# Altium schematic sheet Optoisolators.SchDoc: PDM
size A3; SheetNumber: 6; SheetTotal: 8
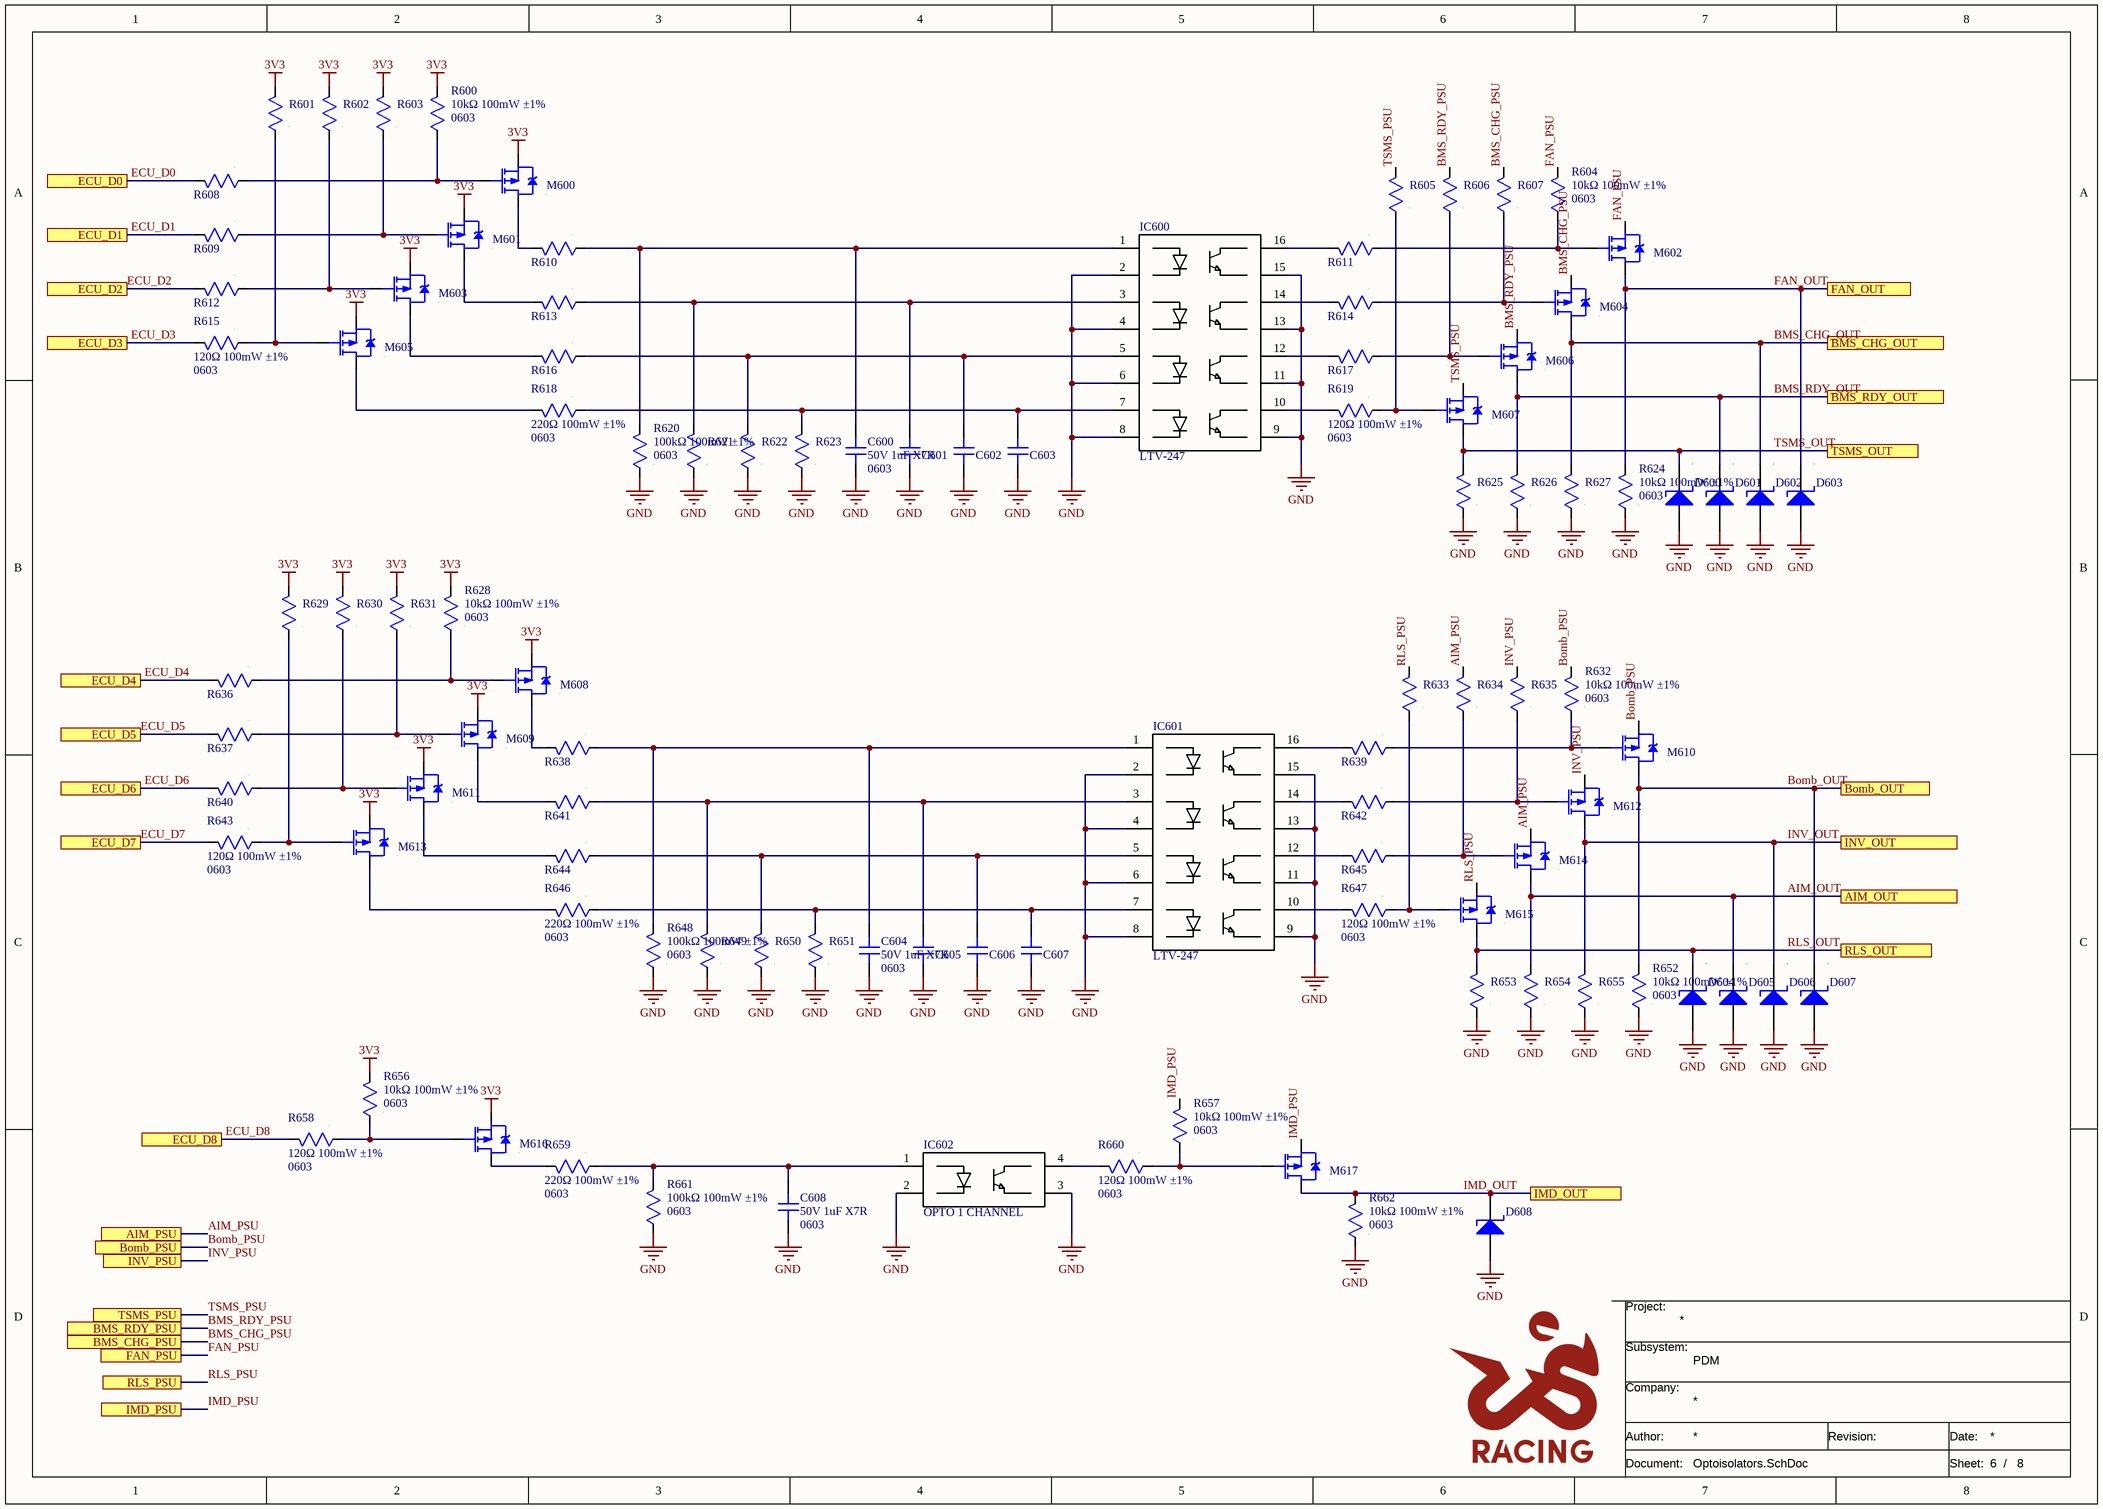
[diagram p0: Optoisolators.SchDoc]

## Parts
C600  value 50V 1uF X7R  Package: 0603  [CAP SMD 0603]  (hidden comment: CAP non polarized)
C601  CAP non polarized  [CAP SMD 0603]  (value not drawn)
C602  CAP non polarized  [CAP SMD 0603]  (value not drawn)
C603  CAP non polarized  [CAP SMD 0603]  (value not drawn)
C604  value 50V 1uF X7R  Package: 0603  [CAP SMD 0603]  (hidden comment: CAP non polarized)
C605  CAP non polarized  [CAP SMD 0603]  (value not drawn)
C606  CAP non polarized  [CAP SMD 0603]  (value not drawn)
C607  CAP non polarized  [CAP SMD 0603]  (value not drawn)
C608  value 50V 1uF X7R  Package: 0603  [CAP SMD 0603]  (hidden comment: CAP non polarized)
D600  DIODE SCHOTTKY  [DO-214AB]  (value not drawn)
D601  DIODE SCHOTTKY  [DO-214AB]  (value not drawn)
D602  DIODE SCHOTTKY  [DO-214AB]  (value not drawn)
D603  DIODE SCHOTTKY  [DO-214AB]  (value not drawn)
D604  DIODE SCHOTTKY  [DO-214AB]  (value not drawn)
D605  DIODE SCHOTTKY  [DO-214AB]  (value not drawn)
D606  DIODE SCHOTTKY  [DO-214AB]  (value not drawn)
D607  DIODE SCHOTTKY  [DO-214AB]  (value not drawn)
D608  DIODE SCHOTTKY  [DO-214AB]  (value not drawn)
IC600  LTV-247  [SOP-16]
IC601  LTV-247  [SOP-16]
IC602  OPTO 1 CHANNEL  [DIP-4]
M600  MOSFET P  [SOT-23]  (value not drawn)
M601  MOSFET P  [SOT-23]  (value not drawn)
M602  MOSFET P  [SOT-23]  (value not drawn)
M603  MOSFET P  [SOT-23]  (value not drawn)
M604  MOSFET P  [SOT-23]  (value not drawn)
M605  MOSFET P  [SOT-23]  (value not drawn)
M606  MOSFET P  [SOT-23]  (value not drawn)
M607  MOSFET P  [SOT-23]  (value not drawn)
M608  MOSFET P  [SOT-23]  (value not drawn)
M609  MOSFET P  [SOT-23]  (value not drawn)
M610  MOSFET P  [TO-252]  (value not drawn)
M611  MOSFET P  [SOT-23]  (value not drawn)
M612  MOSFET P  [SOT-23]  (value not drawn)
M613  MOSFET P  [SOT-23]  (value not drawn)
M614  MOSFET P  [SOT-23]  (value not drawn)
M615  MOSFET P  [SOT-23]  (value not drawn)
M616  MOSFET P  [SOT-23]  (value not drawn)
M617  MOSFET P  [SOT-23]  (value not drawn)
R600  value 10kΩ 100mW ±1%  Package: 0603  [RES SMD 0603]  (hidden comment: RES)
R601  RES  [RES SMD 0603]  (value not drawn)
R602  RES  [RES SMD 0603]  (value not drawn)
R603  RES  [RES SMD 0603]  (value not drawn)
R604  value 10kΩ 100mW ±1%  Package: 0603  [RES SMD 0603]  (hidden comment: RES)
R605  RES  [RES SMD 0603]  (value not drawn)
R606  RES  [RES SMD 0603]  (value not drawn)
R607  RES  [RES SMD 0603]  (value not drawn)
R608  RES  [RES SMD 0603]  (value not drawn)
R609  RES  [RES SMD 0603]  (value not drawn)
R610  RES  [RES SMD 0603]  (value not drawn)
R611  RES  [RES SMD 0603]  (value not drawn)
R612  RES  [RES SMD 0603]  (value not drawn)
R613  RES  [RES SMD 0603]  (value not drawn)
R614  RES  [RES SMD 0603]  (value not drawn)
R615  value 120Ω 100mW ±1%  Package: 0603  [RES SMD 0603]  (hidden comment: RES)
R616  RES  [RES SMD 0603]  (value not drawn)
R617  RES  [RES SMD 0603]  (value not drawn)
R618  value 220Ω 100mW ±1%  Package: 0603  [RES SMD 0603]  (hidden comment: RES)
R619  value 120Ω 100mW ±1%  Package: 0603  [RES SMD 0603]  (hidden comment: RES)
R620  value 100kΩ 100mW ±1%  Package: 0603  [RES SMD 0603]  (hidden comment: RES)
R621  RES  [RES SMD 0603]  (value not drawn)
R622  RES  [RES SMD 0603]  (value not drawn)
R623  RES  [RES SMD 0603]  (value not drawn)
R624  value 10kΩ 100mW ±1%  Package: 0603  [RES SMD 0603]  (hidden comment: RES)
R625  RES  [RES SMD 0603]  (value not drawn)
R626  RES  [RES SMD 0603]  (value not drawn)
R627  RES  [RES SMD 0603]  (value not drawn)
R628  value 10kΩ 100mW ±1%  Package: 0603  [RES SMD 0603]  (hidden comment: RES)
R629  RES  [RES SMD 0603]  (value not drawn)
R630  RES  [RES SMD 0603]  (value not drawn)
R631  RES  [RES SMD 0603]  (value not drawn)
R632  value 10kΩ 100mW ±1%  Package: 0603  [RES SMD 0603]  (hidden comment: RES)
R633  RES  [RES SMD 0603]  (value not drawn)
R634  RES  [RES SMD 0603]  (value not drawn)
R635  RES  [RES SMD 0603]  (value not drawn)
R636  RES  [RES SMD 0603]  (value not drawn)
R637  RES  [RES SMD 0603]  (value not drawn)
R638  RES  [RES SMD 0603]  (value not drawn)
R639  RES  [RES SMD 0603]  (value not drawn)
R640  RES  [RES SMD 0603]  (value not drawn)
R641  RES  [RES SMD 0603]  (value not drawn)
R642  RES  [RES SMD 0603]  (value not drawn)
R643  value 120Ω 100mW ±1%  Package: 0603  [RES SMD 0603]  (hidden comment: RES)
R644  RES  [RES SMD 0603]  (value not drawn)
R645  RES  [RES SMD 0603]  (value not drawn)
R646  value 220Ω 100mW ±1%  Package: 0603  [RES SMD 0603]  (hidden comment: RES)
R647  value 120Ω 100mW ±1%  Package: 0603  [RES SMD 0603]  (hidden comment: RES)
R648  value 100kΩ 100mW ±1%  Package: 0603  [RES SMD 0603]  (hidden comment: RES)
R649  RES  [RES SMD 0603]  (value not drawn)
R650  RES  [RES SMD 0603]  (value not drawn)
R651  RES  [RES SMD 0603]  (value not drawn)
R652  value 10kΩ 100mW ±1%  Package: 0603  [RES SMD 0603]  (hidden comment: RES)
R653  RES  [RES SMD 0603]  (value not drawn)
R654  RES  [RES SMD 0603]  (value not drawn)
R655  RES  [RES SMD 0603]  (value not drawn)
R656  value 10kΩ 100mW ±1%  Package: 0603  [RES SMD 0603]  (hidden comment: RES)
R657  value 10kΩ 100mW ±1%  Package: 0603  [RES SMD 0603]  (hidden comment: RES)
R658  value 120Ω 100mW ±1%  Package: 0603  [RES SMD 0603]  (hidden comment: RES)
R659  value 220Ω 100mW ±1%  Package: 0603  [RES SMD 0603]  (hidden comment: RES)
R660  value 120Ω 100mW ±1%  Package: 0603  [RES SMD 0603]  (hidden comment: RES)
R661  value 100kΩ 100mW ±1%  Package: 0603  [RES SMD 0603]  (hidden comment: RES)
R662  value 10kΩ 100mW ±1%  Package: 0603  [RES SMD 0603]  (hidden comment: RES)

## Ports
AIM_OUT, AIM_PSU, BMS_CHG_OUT, BMS_CHG_PSU, BMS_RDY_OUT, BMS_RDY_PSU, Bomb_OUT, Bomb_PSU, ECU_D0, ECU_D1, ECU_D2, ECU_D3, ECU_D4, ECU_D5, ECU_D6, ECU_D7, ECU_D8, FAN_OUT, FAN_PSU, IMD_OUT, IMD_PSU, INV_OUT, INV_PSU, RLS_OUT, RLS_PSU, TSMS_OUT, TSMS_PSU

## Nets
3V3: M600.2(S) M601.2(S) M603.2(S) M605.2(S) M608.2(S) M609.2(S) M611.2(S) M613.2(S) M616.2(S) R600.2 R601.2 R602.2 R603.2 R628.2 R629.2 R630.2 R631.2 R656.2
GND: C600.2 C601.2 C602.2 C603.2 C604.2 C605.2 C606.2 C607.2 C608.2 D600.A D601.A D602.A D603.A D604.A D605.A D606.A D607.A D608.A IC600.2(K_1) IC600.4(K_2) IC600.6(K_3) IC600.8(K_4) IC600.9(E_4) IC600.11(E_3) IC600.13(E_2) IC600.15(E_1) IC601.2(K_1) IC601.4(K_2) IC601.6(K_3) IC601.8(K_4) IC601.9(E_4) IC601.11(E_3) IC601.13(E_2) IC601.15(E_1) IC602.2(K_1) IC602.3(E_1) R620.1 R621.1 R622.1 R623.1 R624.1 R625.1 R626.1 R627.1 R648.1 R649.1 R650.1 R651.1 R652.1 R653.1 R654.1 R655.1 R661.1 R662.1
AIM_OUT: D605.K M614.3(D) R654.2 ; port AIM_OUT
AIM_PSU: M614.2(S) R634.2 ; port AIM_PSU
BMS_CHG_OUT: D602.K M604.3(D) R627.2 ; port BMS_CHG_OUT
BMS_CHG_PSU: M604.2(S) R607.2 ; port BMS_CHG_PSU
BMS_RDY_OUT: D601.K M606.3(D) R626.2 ; port BMS_RDY_OUT
BMS_RDY_PSU: M606.2(S) R606.2 ; port BMS_RDY_PSU
Bomb_OUT: D607.K M610.3(D) R652.2 ; port Bomb_OUT
Bomb_PSU: M610.2(S) R632.2 ; port Bomb_PSU
ECU_D0: R608.2 ; port ECU_D0
ECU_D1: R609.2 ; port ECU_D1
ECU_D2: R612.2 ; port ECU_D2
ECU_D3: R615.2 ; port ECU_D3
ECU_D4: R636.2 ; port ECU_D4
ECU_D5: R637.2 ; port ECU_D5
ECU_D6: R640.2 ; port ECU_D6
ECU_D7: R643.2 ; port ECU_D7
ECU_D8: R658.2 ; port ECU_D8
FAN_OUT: D603.K M602.3(D) R624.2 ; port FAN_OUT
FAN_PSU: M602.2(S) R604.2 ; port FAN_PSU
IMD_OUT: D608.K M617.3(D) R662.2 ; port IMD_OUT
IMD_PSU: M617.2(S) R657.2 ; port IMD_PSU
INV_OUT: D606.K M612.3(D) R655.2 ; port INV_OUT
INV_PSU: M612.2(S) R635.2 ; port INV_PSU
RLS_OUT: D604.K M615.3(D) R653.2 ; port RLS_OUT
RLS_PSU: M615.2(S) R633.2 ; port RLS_PSU
TSMS_OUT: D600.K M607.3(D) R625.2 ; port TSMS_OUT
TSMS_PSU: M607.2(S) R605.2 ; port TSMS_PSU
NetC600_1: C600.1 IC600.1(A_1) R610.1 R620.2
NetC601_1: C601.1 IC600.3(A_2) R613.1 R621.2
NetC602_1: C602.1 IC600.5(A_3) R616.1 R622.2
NetC603_1: C603.1 IC600.7(A_4) R618.1 R623.2
NetC604_1: C604.1 IC601.1(A_1) R638.1 R648.2
NetC605_1: C605.1 IC601.3(A_2) R641.1 R649.2
NetC606_1: C606.1 IC601.5(A_3) R644.1 R650.2
NetC607_1: C607.1 IC601.7(A_4) R646.1 R651.2
NetC608_1: C608.1 IC602.1(A_1) R659.1 R661.2
NetIC600_10: IC600.10(C_4) R619.2
NetIC600_12: IC600.12(C_3) R617.2
NetIC600_14: IC600.14(C_2) R614.2
NetIC600_16: IC600.16(C_1) R611.2
NetIC601_10: IC601.10(C_4) R647.2
NetIC601_12: IC601.12(C_3) R645.2
NetIC601_14: IC601.14(C_2) R642.2
NetIC601_16: IC601.16(C_1) R639.2
NetIC602_4: IC602.4(C_1) R660.2
NetM600_1: M600.1(G) R600.1 R608.1
NetM600_3: M600.3(D) R610.2
NetM601_1: M601.1(G) R603.1 R609.1
NetM601_3: M601.3(D) R613.2
NetM602_1: M602.1(G) R604.1 R611.1
NetM603_1: M603.1(G) R602.1 R612.1
NetM603_3: M603.3(D) R616.2
NetM604_1: M604.1(G) R607.1 R614.1
NetM605_1: M605.1(G) R601.1 R615.1
NetM605_3: M605.3(D) R618.2
NetM606_1: M606.1(G) R606.1 R617.1
NetM607_1: M607.1(G) R605.1 R619.1
NetM608_1: M608.1(G) R628.1 R636.1
NetM608_3: M608.3(D) R638.2
NetM609_1: M609.1(G) R631.1 R637.1
NetM609_3: M609.3(D) R641.2
NetM610_1: M610.1(G) R632.1 R639.1
NetM611_1: M611.1(G) R630.1 R640.1
NetM611_3: M611.3(D) R644.2
NetM612_1: M612.1(G) R635.1 R642.1
NetM613_1: M613.1(G) R629.1 R643.1
NetM613_3: M613.3(D) R646.2
NetM614_1: M614.1(G) R634.1 R645.1
NetM615_1: M615.1(G) R633.1 R647.1
NetM616_1: M616.1(G) R656.1 R658.1
NetM616_3: M616.3(D) R659.2
NetM617_1: M617.1(G) R657.1 R660.1

## Notes on the sheet
- Project:
- Subsystem:
- Company:
- Document:
- Author:
- Revision:
- Date:
- Sheet:
- /

## Library data of the parts
C600 C603 C604 C607 C608 = 001-0102: Condensadores de cerámica multicapa (MLCC- SMD/SMT) WCAP-CSGP 1uF 50 Vol 10%; MPN: 885012206126; Manufacturer: Wurth Elektronik; ComponentLink1Description: Datasheet; ComponentLink1URL: https://www.we-online.com/components/products/datasheet/885012206126.pdf; ComponentLink2Description: Distributor Link; ComponentLink2URL: https://www.mouser.es/ProductDetail/Wurth-Elektronik/885012206126?qs=amGC7iS6iy%2F%252BJOLb%2FSuwig%3D%3D; ID: 001-0102; Distributor PN: 710-885012206126; Distributor: Mouser
C601 C602 C605 C606 = 001-0102: Condensadores de cerámica multicapa (MLCC- SMD/SMT) WCAP-CSGP 1uF 50 Vol 10%; MPN: 885012206126; Manufacturer: Wurth Elektronik; Value: 50V 1uF X7R; ComponentLink1Description: Datasheet; ComponentLink1URL: https://www.we-online.com/components/products/datasheet/885012206126.pdf; ComponentLink2Description: Distributor Link; ComponentLink2URL: https://www.mouser.es/ProductDetail/Wurth-Elektronik/885012206126?qs=amGC7iS6iy%2F%252BJOLb%2FSuwig%3D%3D; Package: 0603; ID: 001-0102; Distributor PN: 710-885012206126; Distributor: Mouser
D600-D608 = 031-0013: Diodos y rectificadores Schottky 3A 60V; MPN: MBRS360T3G; Manufacturer: onsemi; Value: 60V 3A; ComponentLink1Description: Datasheet; ComponentLink1URL: https://www.onsemi.com/pdf/datasheet/mbrs360t3-d.pdf; ComponentLink2Description: Distributor Link; ComponentLink2URL: https://www.mouser.es/ProductDetail/onsemi/MBRS360T3G?qs=3JMERSakebpuPnGIg0cvPA%3D%3D; ID: 031-0013; Package: DO-214AB; Distributor PN: 863-MBRS360T3G; Distributor: Mouser
IC600 IC601 = 041-0002: Optoacopladores para salidas de transistores PTR 50% 5KV 16 PIN 4CH Optocoupler; Manufacturer: LITEON; ComponentLink1Description: Datasheet; ComponentLink1URL: https://www.mouser.com/catalog/specsheets/Lite-On-07-31-2018-LTV-2X7%20sereis%20Apr18.pdf?_gl=1*hv8h7o*_gcl_aw*R0NMLjE3ODA5NDM2MTUuQ2owS0NRancwSm5SQmhESkFSSXNBTG9iblhiTVZmV3NWb0pqSGVpNWRkTXk2SzRuNEhwRGVRWXYxa0dMT0s1N0VWSjRWQlE1eFhBYUoxd2FBa3NuRUFMd193Y0I.*_gcl_au*MjAyMjI4MzgwOS4xNzc1NDk0ODAwLjEzNjA3ODI2NzguMTc4MzExMDAxNi4xNzgzMTEwMDE2*_ga*Nzg3Njk5NTY0LjE3NDY2Mzg0MjI.*_ga_15W4STQT4T*czE3ODMxMTAwMTYkbzEzNyRnMSR0MTc4MzExMDAxOSRqNTckbDAkaDA.; ComponentLink2Description: Distributor Link; ComponentLink2URL: https://www.mouser.es/ProductDetail/LITEON/LTV-247?qs=9ayhpukWNmvWpoxQBzWkFA%3D%3D; ID: 041-0002; Value: -; Package: SOP-16; MPN: LTV-247; Distributor PN: 859-LTV-247; Distributor: Mouser
IC602 = 041-0003: Optoacopladores para salidas de transistores WL-OCPT 35V 5KVrms 10pF Dip 4 S-Type; MPN: 140817142400; Manufacturer: Wurth Elektronik; ComponentLink1Description: Datasheet; ComponentLink1URL: https://www.we-online.com/catalog/datasheet/140817142400.pdf; ComponentLink2Description: Distributor Link; ComponentLink2URL: https://www.mouser.es/es/ProductDetail/Wurth-Elektronik/140817142400?qs=81r%252BiQLm7BQPLeRqqgk3BQ%3D%3D; ID: 041-0003; Value: -; Package: DIP-4; Distributor PN: 710-140817142400; Distributor: Mouser
M600 M601 M603 M605 M608 M609 M611 M613 M616 = 043-0002: MOSFET -30V Vds 20V Vgs SOT-23; MPN: SI2303CDS-T1-GE3; Manufacturer: Vishay Semiconductors; ComponentLink1Description: Datasheet; ComponentLink1URL: https://www.vishay.com/docs/69991/si2303cd.pdf; ComponentLink2Description: Distributor Link; ComponentLink2URL: https://www.mouser.es/ProductDetail/Vishay-Semiconductors/SI2303CDS-T1-GE3?qs=IRuQNBqMOckJHxNXLRBkmw%3D%3D; ID: 043-0002; Value: P; Package: SOT-23-3; Distributor PN: 781-SI2303CDS-T1-GE3; Distributor: Mouser
M602 M604 M606 M607 M612 M614 M615 M617 = 043-0006: MOSFET 30V P-Ch Enh Mode 50mOhm -10Vgs -4.3A; MPN: DMP3056L-7; Manufacturer: Diodes Incorporated; ComponentLink1Description: Datasheet; ComponentLink1URL: https://4donline.ihs.com/images/VipMasterIC/IC/DIOD/DIOD-S-A0012884531/DIOD-S-A0012915142-1.pdf?hkey=CECEF36DEECDED6468708AAF2E19C0C6; ComponentLink2Description: Distributor Link; ComponentLink2URL: https://www.mouser.es/es/ProductDetail/Diodes-Incorporated/DMP3056L-7?qs=OVC8WVYZliQTX9kMWW%252B96Q%3D%3D; ID: 043-0006; Value: P; Package: SOT-23-3; Distributor PN: 621-DMP3056L-7; Distributor: Mouser
M610 = 043-0005: MOSFET MOSFET BVDSS: 41V-60 TO252,2.5K; MPN: DMP4015SK3-13; Manufacturer: Diodes Incorporated; ComponentLink1Description: Datasheet; ComponentLink1URL: https://www.mouser.es/datasheet/3/175/1/DMP4015SK3.pdf; ComponentLink2Description: Distributor Link; ComponentLink2URL: https://www.mouser.es/es/ProductDetail/Diodes-Incorporated/DMP4015SK3-13?qs=T%2FOtf55vL7fON%252BtWokt2Lw%3D%3D; ID: 043-0005; Value: P; Package: TO-252-3; Distributor PN: 621-DMP4015SK3-13; Distributor: Mouser
R600 R604 R624 R628 R632 R652 R656 R657 R662 = 010-0145: Resistores de película gruesa - SMD WRIS-RSKS 10 kOhms 1 % 0.1 W 0603 AEC-Q200; MPN: 560112116005; Manufacturer: Wurth Elektronik; ComponentLink1Description: Datasheet; ComponentLink1URL: https://www.we-online.com/components/products/datasheet/560112116005.pdf; ComponentLink2Description: Distributor Link; ComponentLink2URL: https://www.mouser.es/ProductDetail/Wurth-Elektronik/560112116005?qs=mELouGlnn3dMVSPHwBGouA%3D%3D; ID: 010-0145; Distributor PN: 710-560112116005; Distributor: Mouser
R601-R603 R605-R607 R625-R627 R629-R631 R633-R635 R653-R655 = 010-0145: Resistores de película gruesa - SMD WRIS-RSKS 10 kOhms 1 % 0.1 W 0603 AEC-Q200; MPN: 560112116005; Manufacturer: Wurth Elektronik; Value: 10kΩ 100mW ±1%; ComponentLink1Description: Datasheet; ComponentLink1URL: https://www.we-online.com/components/products/datasheet/560112116005.pdf; ComponentLink2Description: Distributor Link; ComponentLink2URL: https://www.mouser.es/ProductDetail/Wurth-Elektronik/560112116005?qs=mELouGlnn3dMVSPHwBGouA%3D%3D; Package: 0603; ID: 010-0145; Distributor PN: 710-560112116005; Distributor: Mouser
R608 R609 R611 R612 R614 R617 R636 R637 R639 R640 R642 R645 = 010-0177: Resistores de película gruesa - SMD WRIS-RSKS 120 Ohms 1 % 0.1 W 0603 AEC-Q200; MPN: 560112116119; Manufacturer: Wurth Elektronik; Value: 120Ω 100mW ±1%; ComponentLink1Description: Datasheet; ComponentLink1URL: https://www.we-online.com/components/products/datasheet/560112116119.pdf; ComponentLink2Description: Distributor Link; ComponentLink2URL: https://www.mouser.es/ProductDetail/Wurth-Elektronik/560112116119?qs=mELouGlnn3eT%2F22oIMY8Ng%3D%3D; Package: 0603; ID: 010-0177; Distributor PN: 710-560112116119; Distributor: Mouser
R610 R613 R616 R638 R641 R644 = 010-0191: Resistores de película gruesa - SMD WRIS-RSKS 220 Ohms 1 % 0.1 W 0603 AEC-Q200; MPN: 560112116126; Manufacturer: Wurth Elektronik; Value: 220Ω 100mW ±1%; ComponentLink1Description: Datasheet; ComponentLink1URL: https://www.we-online.com/components/products/datasheet/560112116126.pdf; ComponentLink2Description: Distributor Link; Package: 0603; ID: 010-0191; Distributor PN: 710-560112116126; Distributor: Mouser
R615 R619 R643 R647 R658 R660 = 010-0177: Resistores de película gruesa - SMD WRIS-RSKS 120 Ohms 1 % 0.1 W 0603 AEC-Q200; MPN: 560112116119; Manufacturer: Wurth Elektronik; ComponentLink1Description: Datasheet; ComponentLink1URL: https://www.we-online.com/components/products/datasheet/560112116119.pdf; ComponentLink2Description: Distributor Link; ComponentLink2URL: https://www.mouser.es/ProductDetail/Wurth-Elektronik/560112116119?qs=mELouGlnn3eT%2F22oIMY8Ng%3D%3D; ID: 010-0177; Distributor PN: 710-560112116119; Distributor: Mouser
R618 R646 R659 = 010-0191: Resistores de película gruesa - SMD WRIS-RSKS 220 Ohms 1 % 0.1 W 0603 AEC-Q200; MPN: 560112116126; Manufacturer: Wurth Elektronik; ComponentLink1Description: Datasheet; ComponentLink1URL: https://www.we-online.com/components/products/datasheet/560112116126.pdf; ComponentLink2Description: Distributor Link; ID: 010-0191; Distributor PN: 710-560112116126; Distributor: Mouser
R620 R623 R648 R651 R661 = 010-0190: Thick Film Resistors WRIS-RSKS 100 kOhms 1 % 0.1 W 0603 AEC-Q200; MPN: 560112116004; Manufacturer: Wurth Elektronik; ComponentLink1Description: Datasheet; ComponentLink1URL: https://www.we-online.com/components/products/datasheet/560112116004.pdf; ComponentLink2Description: Distributor Link; ComponentLink2URL: https://www.mouser.es/ProductDetail/Wurth-Elektronik/560112116004?qs=sGAEpiMZZMvdGkrng054txLI%2FDB4oIKDB%252BmfBE1ySSGuQklCN21gzA%3D%3D; ID: 010-0190; Distributor PN: 710-560112116004; Distributor: Mouser
R621 R622 R649 R650 = 010-0190: Thick Film Resistors WRIS-RSKS 100 kOhms 1 % 0.1 W 0603 AEC-Q200; MPN: 560112116004; Manufacturer: Wurth Elektronik; Value: 100kΩ 100mW ±1%; ComponentLink1Description: Datasheet; ComponentLink1URL: https://www.we-online.com/components/products/datasheet/560112116004.pdf; ComponentLink2Description: Distributor Link; ComponentLink2URL: https://www.mouser.es/ProductDetail/Wurth-Elektronik/560112116004?qs=sGAEpiMZZMvdGkrng054txLI%2FDB4oIKDB%252BmfBE1ySSGuQklCN21gzA%3D%3D; Package: 0603; ID: 010-0190; Distributor PN: 710-560112116004; Distributor: Mouser